# Altium project Course_Work.PrjPcb
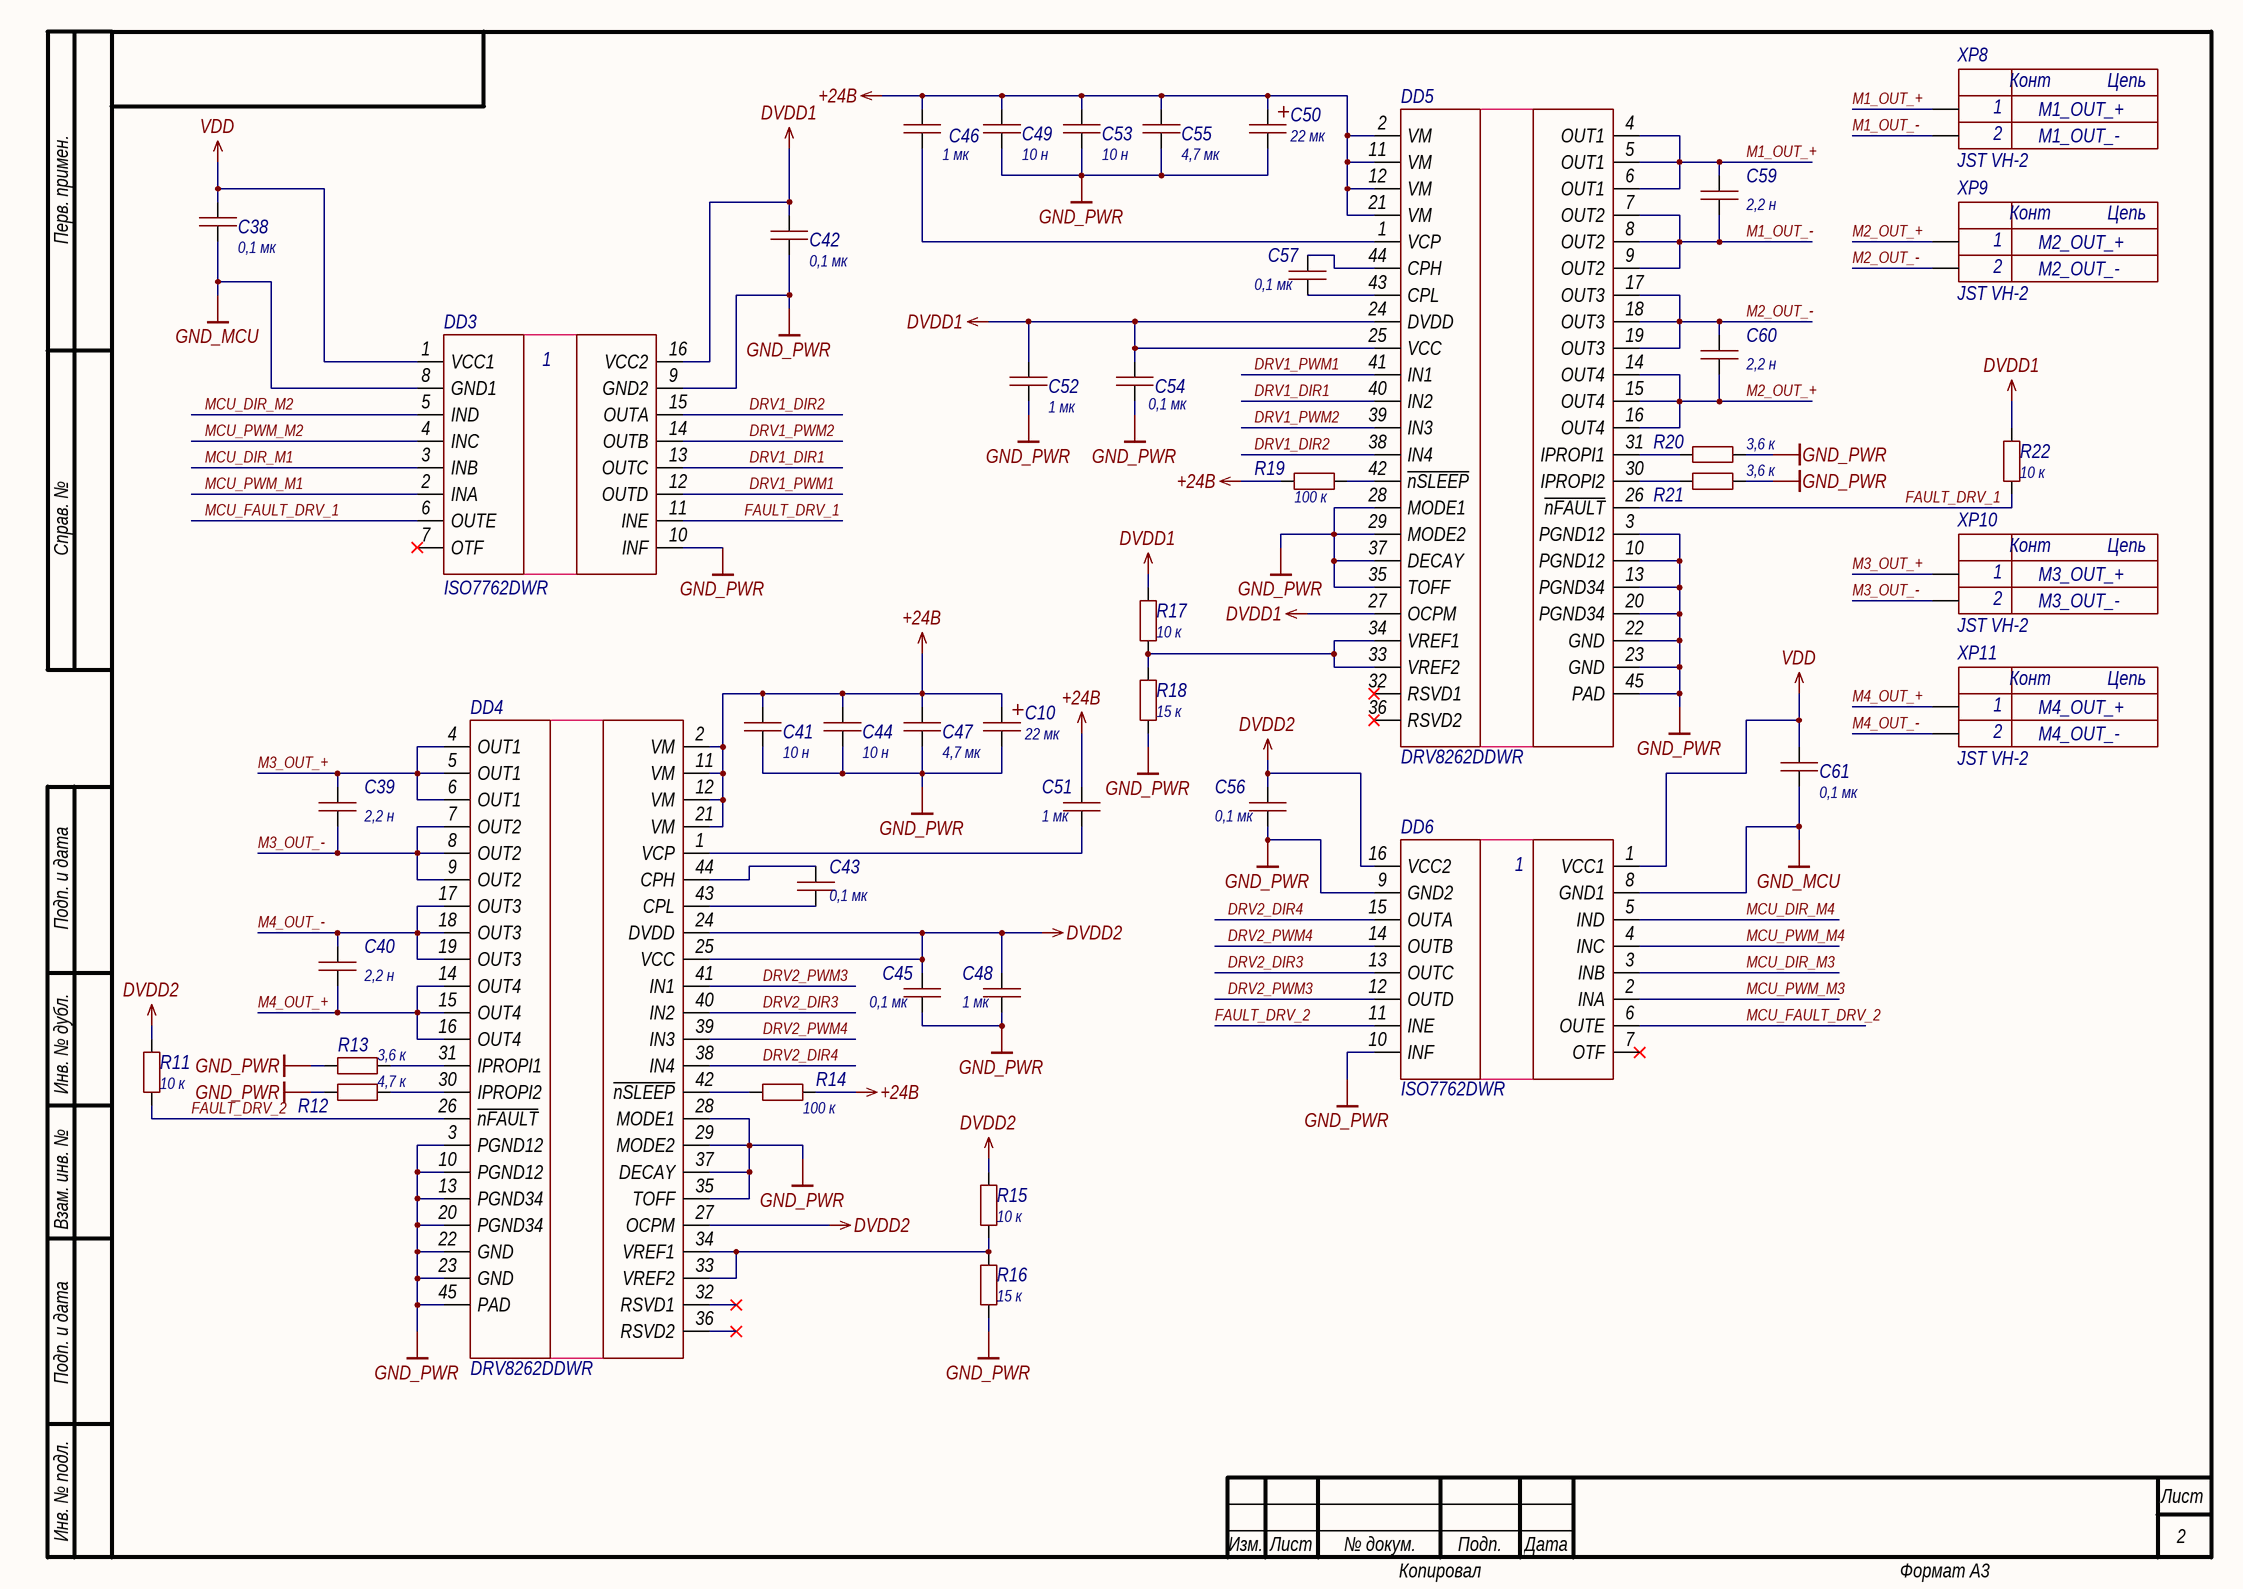
[diagram p0: Drivers.SchDoc]
1 sheet, 44 parts. Net scope: global (net labels, ports and power ports of the same name join across sheets).
Board files: PCB2.PcbDoc, PCB1_new.PcbDoc

## Sheet Drivers.SchDoc
size 420 x 297 mm; SheetNumber: 2; SheetTotal: 2

### Parts
C10  value 22 мк  [TC_A]  (hidden comment: Capacitor)
C38  value 0,1 мк  [0402C]  (hidden comment: Capacitor)
C39  value 2,2 н  [0603C]  (hidden comment: Capacitor)
C40  value 2,2 н  [0603C]  (hidden comment: Capacitor)
C41  value 10 н  [0603C]  (hidden comment: Capacitor)
C42  value 0,1 мк  [0402C]  (hidden comment: Capacitor)
C43  value 0,1 мк  [0402C]  (hidden comment: Capacitor)
C44  value 10 н  [0603C]  (hidden comment: Capacitor)
C45  value 0,1 мк  [0402C]  (hidden comment: Capacitor)
C46  value 1 мк  [0603C]  (hidden comment: Capacitor)
C47  value 4,7 мк  [1206C]  (hidden comment: Capacitor)
C48  value 1 мк  [0603C]  (hidden comment: Capacitor)
C49  value 10 н  [0603C]  (hidden comment: Capacitor)
C50  value 22 мк  [TC_A]  (hidden comment: Capacitor)
C51  value 1 мк  [0603C]  (hidden comment: Capacitor)
C52  value 1 мк  [0603C]  (hidden comment: Capacitor)
C53  value 10 н  [0603C]  (hidden comment: Capacitor)
C54  value 0,1 мк  [0402C]  (hidden comment: Capacitor)
C55  value 4,7 мк  [1206C]  (hidden comment: Capacitor)
C56  value 0,1 мк  [0402C]  (hidden comment: Capacitor)
C57  value 0,1 мк  [0402C]  (hidden comment: Capacitor)
C59  value 2,2 н  [0603C]  (hidden comment: Capacitor)
C60  value 2,2 н  [0603C]  (hidden comment: Capacitor)
C61  value 0,1 мк  [0402C]  (hidden comment: Capacitor)
DD3  ISO7762DWR  [SOIC-16]
DD4  DRV8262DDWR  [HTSSOP44-DDW_TEX]
DD5  DRV8262DDWR  [HTSSOP44-DDW_TEX]
DD6  ISO7762DWR  [SOIC-16]
R11  value 10 к  [0603R]  (hidden comment: Resistor)
R12  value 4,7 к  [0603R]  (hidden comment: Resistor)
R13  value 3,6 к  [0603R]  (hidden comment: Resistor)
R14  value 100 к  [0603R]  (hidden comment: Resistor)
R15  value 10 к  [0603R]  (hidden comment: Resistor)
R16  value 15 к  [0603R]  (hidden comment: Resistor)
R17  value 10 к  [0603R]  (hidden comment: Resistor)
R18  value 15 к  [0603R]  (hidden comment: Resistor)
R19  value 100 к  [0603R]  (hidden comment: Resistor)
R20  value 3,6 к  [0603R]  (hidden comment: Resistor)
R21  value 3,6 к  [0603R]  (hidden comment: Resistor)
R22  value 10 к  [0603R]  (hidden comment: Resistor)
XP8  JST VH-2  [B2P-VH]
XP9  JST VH-2  [B2P-VH]
XP10  JST VH-2  [B2P-VH]
XP11  JST VH-2  [B2P-VH]

### Nets
+24В: C10.1 C41.2 C44.2 C46.2 C47.2 C49.2 C50.1 C51.2 C53.2 C55.2 DD4.2(VM) DD4.11(VM) DD4.12(VM) DD4.21(VM) DD5.2(VM) DD5.11(VM) DD5.12(VM) DD5.21(VM) R14.1 R19.1
DVDD1: C42.2 C52.2 C54.2 DD3.16(VCC2) DD5.24(DVDD) DD5.25(VCC) DD5.27(OCPM) R17.2 R22.1
DVDD2: C45.2 C48.2 C56.2 DD4.24(DVDD) DD4.25(VCC) DD4.27(OCPM) DD6.16(VCC2) R11.1 R15.2
GND_MCU: C38.1 C61.1 DD3.8(GND1) DD6.8(GND1)
GND_PWR: C10.2 C41.1 C42.1 C44.1 C45.1 C47.1 C48.1 C49.1 C50.2 C52.1 C53.1 C54.1 C55.1 C56.1 DD3.9(GND2) DD3.10(INF) DD4.3(PGND12) DD4.10(PGND12) DD4.13(PGND34) DD4.20(PGND34) DD4.22(GND) DD4.23(GND) DD4.28(MODE1) DD4.29(MODE2) DD4.35(TOFF) DD4.37(DECAY) DD4.45(PAD) DD5.3(PGND12) DD5.10(PGND12) DD5.13(PGND34) DD5.20(PGND34) DD5.22(GND) DD5.23(GND) DD5.28(MODE1) DD5.29(MODE2) DD5.35(TOFF) DD5.37(DECAY) DD5.45(PAD) DD6.9(GND2) DD6.10(INF) R12.2 R13.2 R16.1 R18.1 R20.2 R21.2
VDD: C38.2 C61.2 DD3.1(VCC1) DD6.1(VCC1)
DRV1_DIR1: DD3.13(OUTC) DD5.40(IN2)
DRV1_DIR2: DD3.15(OUTA) DD5.38(IN4)
DRV1_PWM1: DD3.12(OUTD) DD5.41(IN1)
DRV1_PWM2: DD3.14(OUTB) DD5.39(IN3)
DRV2_DIR3: DD4.40(IN2) DD6.13(OUTC)
DRV2_DIR4: DD4.38(IN4) DD6.15(OUTA)
DRV2_PWM3: DD4.41(IN1) DD6.12(OUTD)
DRV2_PWM4: DD4.39(IN3) DD6.14(OUTB)
FAULT_DRV_1: DD3.11(INE) DD5.26(~{nFAULT}) R22.2
FAULT_DRV_2: DD4.26(~{nFAULT}) DD6.11(INE) R11.2
M1_OUT_+: C59.2 DD5.4(OUT1) DD5.5(OUT1) DD5.6(OUT1) XP8.1
M1_OUT_-: C59.1 DD5.7(OUT2) DD5.8(OUT2) DD5.9(OUT2) XP8.2
M2_OUT_+: C60.1 DD5.14(OUT4) DD5.15(OUT4) DD5.16(OUT4) XP9.1
M2_OUT_-: C60.2 DD5.17(OUT3) DD5.18(OUT3) DD5.19(OUT3) XP9.2
M3_OUT_+: C39.2 DD4.4(OUT1) DD4.5(OUT1) DD4.6(OUT1) XP10.1
M3_OUT_-: C39.1 DD4.7(OUT2) DD4.8(OUT2) DD4.9(OUT2) XP10.2
M4_OUT_+: C40.1 DD4.14(OUT4) DD4.15(OUT4) DD4.16(OUT4) XP11.1
M4_OUT_-: C40.2 DD4.17(OUT3) DD4.18(OUT3) DD4.19(OUT3) XP11.2
MCU_DIR_M1: DD3.3(INB)
MCU_DIR_M2: DD3.5(IND)
MCU_DIR_M3: DD6.3(INB)
MCU_DIR_M4: DD6.5(IND)
MCU_FAULT_DRV_1: DD3.6(OUTE)
MCU_FAULT_DRV_2: DD6.6(OUTE)
MCU_PWM_M1: DD3.2(INA)
MCU_PWM_M2: DD3.4(INC)
MCU_PWM_M3: DD6.2(INA)
MCU_PWM_M4: DD6.4(INC)
NetC43_1: C43.1 DD4.43(CPL)
NetC43_2: C43.2 DD4.44(CPH)
NetC46_1: C46.1 DD5.1(VCP)
NetC51_1: C51.1 DD4.1(VCP)
NetC57_1: C57.1 DD5.43(CPL)
NetC57_2: C57.2 DD5.44(CPH)
NetDD4_30: DD4.30(IPROPI2) R12.1
NetDD4_31: DD4.31(IPROPI1) R13.1
NetDD4_33: DD4.33(VREF2) DD4.34(VREF1) R15.1 R16.2
NetDD4_42: DD4.42(~{nSLEEP}) R14.2
NetDD5_30: DD5.30(IPROPI2) R21.1
NetDD5_31: DD5.31(IPROPI1) R20.1
NetDD5_33: DD5.33(VREF2) DD5.34(VREF1) R17.1 R18.2
NetDD5_42: DD5.42(~{nSLEEP}) R19.2

Not connected (* = marked no-connect by the designer): DD3 7(OTF)*; DD4 32(RSVD1)* 36(RSVD2)*; DD5 32(RSVD1)* 36(RSVD2)*; DD6 7(OTF)*

### Notes on the sheet
- M1_OUT_+
- M1_OUT_-
- M2_OUT_+
- M2_OUT_-
- M3_OUT_+
- M3_OUT_-
- M4_OUT_+
- M4_OUT_-
- Перв. примен.
- Справ. №
- Подп. и дата
- Инв. № дубл.
- Взам. инв. №
- Инв. № подл.
- Изм.
- Лист
- № докум.
- Подп.
- Дата
- Копировал
- Формат А3
- (in symbol JST VH-2) Конт; Цепь

### Library data of the parts
C10 C50 = Capacitor_22u_10_50V_TC_A: Танталовый конденсатор; Tolerance: 0,1; Voltage (V): 50; Type: Tantalum; Capacity (uF): 22; Part Number: Capacitor_22u_10_50V_TC_A
C38 C42 C43 C45 C54 C56 C57 C61 = Capacitor_0,1u_10_16V_X7R_0603C: Конденсатор 0402C ёмкостью 0,1 мк 10%, 16 В, X7R; Voltage (V): 16; Capacity (nF): 100; Автор: rreali; Part Number: Capacitor_0,1u_10_16V_X7R_0603C; Tolerance: 10%; Dielectric: X7R
C39 C40 C59 C60 = Capacitor_2,2n_10_50V_X7R_0603C: Конденсатор 0603C ёмкостью 2,2 н 10%, 50 В, X7R; Voltage (V): 50; Capacity (nF): 2,2; Part Number: Capacitor_2,2n_10_50V_X7R_0603C; Tolerance: 10%; Dielectric: X7R
C41 C44 C49 C53 = Capacitor_10n_10_50V_X7R_0603C: Конденсатор 0603C ёмкостью 10 н 10%, 50 В, X7R; Voltage (V): 50; Capacity (nF): 10; Part Number: Capacitor_10n_10_50V_X7R_0603C; Tolerance: 10%; Dielectric: X7R
C46 C48 C51 C52 = Capacitor_1u_10_25V_X7R_0603C: Конденсатор 0603C ёмкостью 1 мк 10%, 25 В, X7R; Voltage (V): 25; Capacity (nF): 1000; Part Number: Capacitor_1u_10_25V_X7R_0603C; Tolerance: 10%; Dielectric: X7R
C47 C55 = Capacitor_4,7u_10_50V_X7R_1206C: Конденсатор 1206C ёмкостью 4,7 мк 10%, 50 В, X7R; Voltage (V): 50; Capacity (nF): 4700; Part Number: Capacitor_4,7u_10_50V_X7R_1206C; Tolerance: 10%; Dielectric: X7R
DD3 DD6 = ISO7762DWR: Шестиканальный цифровой изолятор; Part Number: ISO7762DWR
DD4 DD5 = DRV8262DDWR: Спаренный драйвер управления ДПТ; Part Number: DRV8262DDWR
R11 R15 R17 R22 = Resistor_10k_1_0603: Резистор номиналом 10 кОм 1%; Power: *; Part Number: Resistor_10k_1_0603; Tolerance: 1%
R12 = Resistor_4.7k_1_0603: Резистор номиналом 4,7 кОм 1%; Power: *; Part Number: Resistor_4.7k_1_0603; Tolerance: 1%
R13 R20 R21 = Resistor_3.6k_1_0603: Резистор номиналом 3,6 кОм 1%; Power: *; Part Number: Resistor_3.6k_1_0603; Tolerance: 1%
R14 R19 = Resistor_100k_1_0603: Резистор номиналом 100 кОм 1%; Power: *; Part Number: Resistor_100k_1_0603; Tolerance: 1%
R16 R18 = Resistor_15k_1_0603: Резистор номиналом 15 кОм 1%; Power: *; Part Number: Resistor_15k_1_0603; Tolerance: 1%
XP8-XP11 = JST VH-2: Вилка силовая 2-контактная на плату прямая, шаг 3,96 мм; Автор: Макс; Part Number: JST VH-2; Datasheet: https://www.tme.eu/en/details/b2p-vh/raster-signal-connectors-3-96mm/jst/b2p-vh-lf-sn/